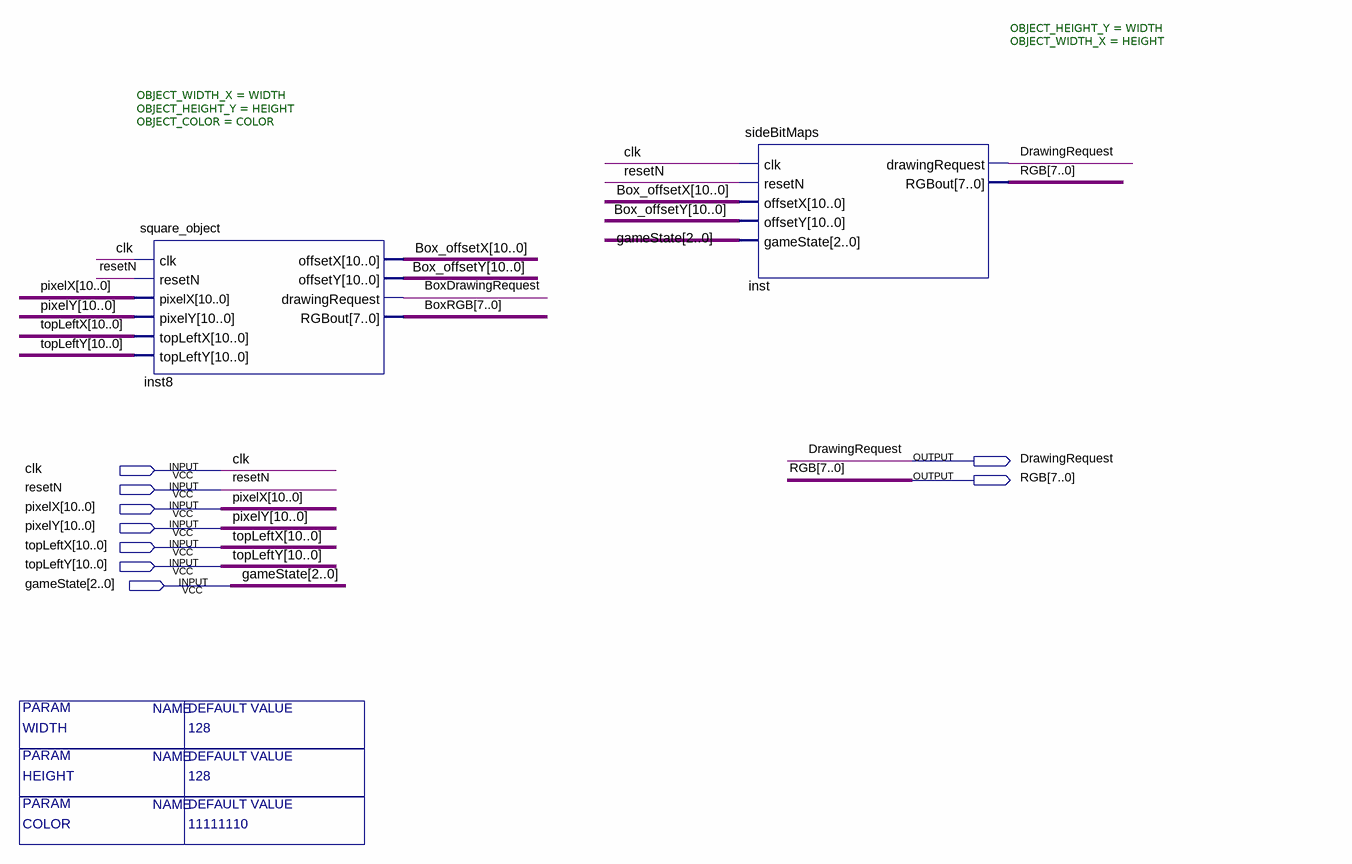
[diagram p0: schematic sheet]
// Quartus schematic genericBitMapTop.bdf as structural Verilog: 2 symbols, 9 pins
module genericBitMapTop #(parameter COLOR = 11111110, parameter WIDTH = 128, parameter HEIGHT = 128) (
  input  clk,
  input  resetN,
  input  [10:0] pixelX,
  input  [10:0] pixelY,
  input  [10:0] topLeftX,
  input  [10:0] topLeftY,
  input  [2:0] gameState,
  output DrawingRequest,
  output [7:0] RGB
);

  wire BoxDrawingRequest;
  wire [7:0] BoxRGB;
  wire [10:0] Box_offsetX, Box_offsetY;

  square_object #(.OBJECT_WIDTH_X(WIDTH), .OBJECT_HEIGHT_Y(HEIGHT), .OBJECT_COLOR(COLOR)) inst8 (
    .clk(clk), .resetN(resetN), .pixelX(pixelX), .pixelY(pixelY), .topLeftX(topLeftX), .topLeftY(topLeftY),
    .offsetX(Box_offsetX), .offsetY(Box_offsetY), .drawingRequest(BoxDrawingRequest), .RGBout(BoxRGB));
  sideBitMaps #(.OBJECT_HEIGHT_Y(WIDTH), .OBJECT_WIDTH_X(HEIGHT)) inst (
    .clk(clk), .resetN(resetN), .offsetX(Box_offsetX), .offsetY(Box_offsetY), .gameState(gameState),
    .drawingRequest(DrawingRequest), .RGBout(RGB));
endmodule
